# Altium schematic sheet GR_carte_alim27.SchDoc
size A4; SheetNumber: 1; SheetTotal: 1
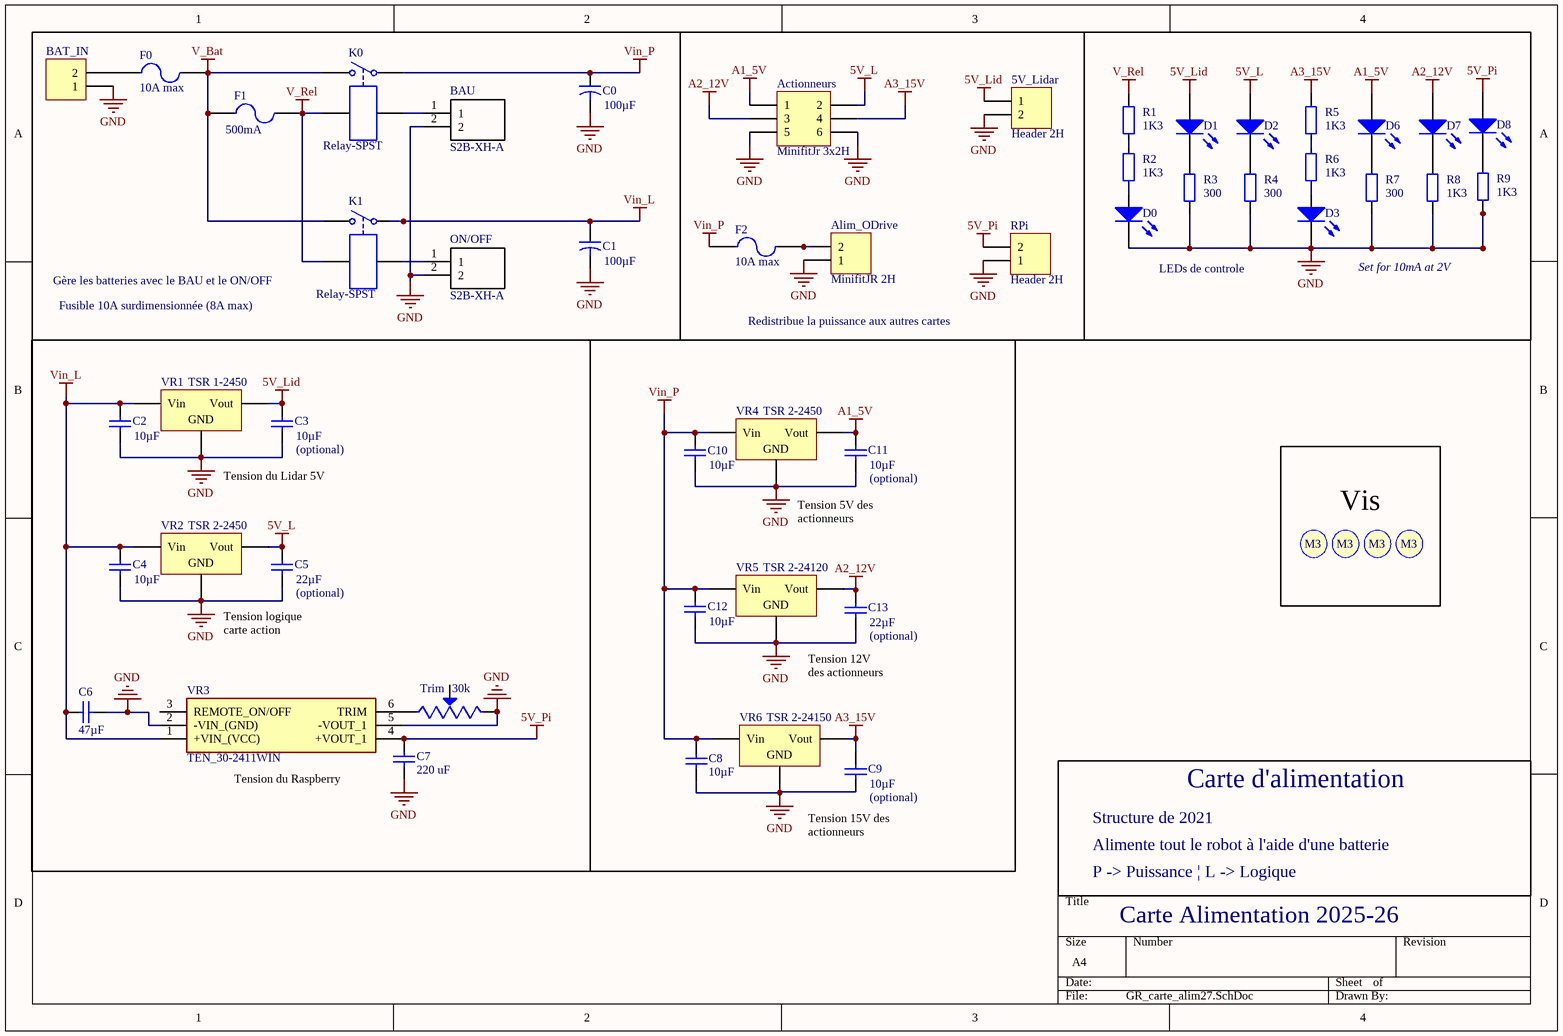
[diagram p0: GR_carte_alim27.SchDoc]

## Parts
5V_Lidar  Header 2H  [S2B-XH-A]
Actionneurs  MinifitJr 3x2H  [MOLEX_MINIFITJR_3X2]
Alim_ODrive  MinifitJR 2H  [Molex_MiniFitJr_2x1H]
BAT_IN  Battery Onboard Solder  [Battery SALE]  (value not drawn)
BAU  S2B-XH-A  [S2B-XH-A]
C0  value 100µF  [Condensateur]  (hidden comment: Cap2)
C1  value 100µF  [Condensateur]  (hidden comment: Cap2)
C2  value 10µF  [Capacitor 1206]  (hidden comment: Cap)
C3  (optional)  value 10µF  [Capacitor 1206]
C4  value 10µF  [Capacitor 1206]  (hidden comment: Cap)
C5  (optional)  value 22µF  [Capacitor 1206]
C6  value 47µF  [Capacitor 1206]  (hidden comment: Cap)
C7  value 220 uF  [Capacitor 1206]  (hidden comment: Cap)
C8  value 10µF  [Capacitor 1206]  (hidden comment: Cap)
C9  (optional)  value 10µF  [Capacitor 1206]
C10  value 10µF  [Capacitor 1206]  (hidden comment: Cap)
C11  (optional)  value 10µF  [Capacitor 1206]
C12  value 10µF  [Capacitor 1206]  (hidden comment: Cap)
C13  (optional)  value 22µF  [Capacitor 1206]
D0  V_Rel  [KP-3216SEC]  (value not drawn)
D1  5V_L  [KP-3216SEC]  (value not drawn)
D2  5V_Lid  [KP-3216SEC]  (value not drawn)
D3  V_Rel  [KP-3216SEC]  (value not drawn)
D6  A_1  [KP-3216SEC]  (value not drawn)
D7  A_2_12V  [KP-3216SEC]  (value not drawn)
D8  A_2_12V  [KP-3216SEC]  (value not drawn)
F0  10A max  [Fuse - duplicate]
F1  500mA  [3.5X2.8X1.9]
F2  10A max  [Fuse - duplicate]
K0  Relay-SPST  [Relay]
K1  Relay-SPST  [Relay]
ON/OFF  S2B-XH-A  [S2B-XH-A]
R1  value 1K3  [Resistor 1206]  (hidden comment: Res2)
R2  value 1K3  [Resistor 1206]  (hidden comment: Res2)
R3  value 300  [Resistor 1206]  (hidden comment: Res2)
R4  value 300  [Resistor 1206]  (hidden comment: Res2)
R5  value 1K3  [Resistor 1206]  (hidden comment: Res2)
R6  value 1K3  [Resistor 1206]  (hidden comment: Res2)
R7  300  [Resistor 1206]
R8  1K3  [Resistor 1206]
R9  1K3  [Resistor 1206]
RPi  Header 2H  [Molex_MiniFitJr_2x1H]
S1  Screw M3  [Screw M3]  (value not drawn)
S2  Screw M3  [Screw M3]  (value not drawn)
S3  Screw M3  [Screw M3]  (value not drawn)
S4  Screw M3  [Screw M3]  (value not drawn)
Trim  30k  [TRIM_3296W-1-303]
VR1  TSR 1-2450  [TRS]
VR2  TSR 2-2450  [TRS]
VR3  TEN_30-2411WIN  [TEN302411WIN]
VR4  TSR 2-2450  [TRS]
VR5  TSR 2-24120  [TRS]
VR6  TSR 2-24150  [TRS]

## Blocks framed on the sheet
Redistribue la puissance aux autres cartes: 5V_Lidar Actionneurs Alim_ODrive F2 RPi

## Nets
5V_L: Actionneurs.2 C5.2 D2.1(A) VR2.3(Vout)
5V_Lid: 5V_Lidar.1 C3.2 D1.1(A) VR1.3(Vout)
5V_Pi: C7.1 D8.1(A) RPi.2 VR3.4(+VOUT_1)
A1_5V: Actionneurs.1 C11.2 D6.1(A) VR4.3(Vout)
A2_12V: Actionneurs.3 C13.2 D7.1(A) VR5.3(Vout)
A3_15V: Actionneurs.4 C9.2 R5.1 VR6.3(Vout)
GND: 5V_Lidar.2 Actionneurs.5 Actionneurs.6 Alim_ODrive.1 BAT_IN.1 BAU.2 C0.2 C1.2 C2.1 C3.1 C4.1 C5.1 C6.1 C7.2 C8.2 C9.1 C10.1 C11.1 C12.1 C13.1 D0.2(K) D3.2(K) ON/OFF.2 R3.1 R4.1 R7.2 R8.2 R9.2 RPi.1 Trim.3(CW) VR1.2(GND) VR2.2(GND) VR3.2(-VIN_(GND)) VR3.5(-VOUT_1) VR4.2(GND) VR5.2(GND) VR6.2(GND)
V_Bat: F0.2 F1.1 K0.2 K1.2
V_Rel: F1.2 K0.4 K1.4 R1.1
Vin_L: C1.1 C2.2 C4.2 C6.2 K1.1 VR1.1(Vin) VR2.1(Vin) VR3.1(+VIN_(VCC))
Vin_P: C0.1 C8.1 C10.2 C12.2 F2.1 K0.1 VR4.1(Vin) VR5.1(Vin) VR6.1(Vin)
NetAlim_ODrive_2: Alim_ODrive.2 F2.2
NetBAT_IN_2: BAT_IN.2 F0.1
NetBAU_1: BAU.1 K0.3
NetD0_1: D0.1(A) R2.2
NetD1_2: D1.2(K) R3.2
NetD2_2: D2.2(K) R4.2
NetD3_1: D3.1(A) R6.2
NetD6_2: D6.2(K) R7.1
NetD7_2: D7.2(K) R8.1
NetD8_2: D8.2(K) R9.1
NetK1_3: K1.3 ON/OFF.1
NetR1_2: R1.2 R2.1
NetR5_2: R5.2 R6.1
NetTrim_1: Trim.1(CCW) VR3.6(TRIM)

Not connected (* = marked no-connect by the designer): Trim 2(WIPER); VR3 3(REMOTE_ON/OFF)

## Notes on the sheet
- (near K1) Gère les batteries avec le BAU et le ON/OFF
- Fusible 10A surdimensionnée (8A max)
- LEDs de controle
- Set for 10mA at 2V
- Tension du Lidar 5V
- Vis
- Tension 5V des actionneurs
- Tension logique carte action
- Tension 12V des actionneurs
- (near VR3) Tension du Raspberry
- Carte d'alimentation
- Tension 15V des actionneurs
- Structure de 2021
- Alimente tout le robot à l'aide d'une batterie
- P -> Puissance | L -> Logique
- Carte Alimentation 2025-26
- (in symbol Screw M3) M3

## Library data of the parts
5V_Lidar RPi = Header 2H: Header, 2-Pin, Right Angle; LatestRevisionDate: 17-Jul-2002; LatestRevisionNote: Re-released for DXP Platform.; Publisher: Altium Limited
Actionneurs = Header 3X2H: Header, 3-Pin, Dual row, Right Angle; LatestRevisionDate: 17-Jul-2002; LatestRevisionNote: Re-released for DXP Platform.; Publisher: Altium Limited
Alim_ODrive = Header 2: Header, 2-Pin; LatestRevisionDate: 17-Jul-2002; LatestRevisionNote: Re-released for DXP Platform.; Publisher: Altium Limited
BAT_IN = Header 2: Header, 2-Pin / Battery Onboard Solder / 24V; LatestRevisionDate: 17-Jul-2002; LatestRevisionNote: Re-released for DXP Platform.; Publisher: Altium Limited
BAU ON/OFF = S2B-XH-A-1_LF__SN_: Connector; Manufacturer_Name: JST (JAPAN SOLDERLESS TERMINALS); Manufacturer_Part_Number: S2B-XH-A-1(LF)(SN); Datasheet Link: http://www.jst-mfg.com/product/pdf/eng/eXH.pdf; Height: 6.1mm; Arrow Part Number: S2B-XH-A-1(LF)(SN)
C0 C1 = Cap2: Capacitor; Published: 23-Sep-2002; PackageReference: CAPR5-4X5; Publisher: Altium Limited; PackageDescription: Capacitor; 2 Leads
C2-C13 = Cap: Capacitor; Published: 8-Jun-2000; LatestRevisionDate: 17-Jul-2002; LatestRevisionNote: Re-released for DXP Platform.; PackageReference: RAD-0.3; Publisher: Altium Limited; PackageDescription: Radial Cap, Thru-Hole; 2 Leads; 0.3 in Pin Spacing
D0-D3 D6-D8 = LED2: Typical RED, GREEN, YELLOW, AMBER GaAs LED; Published: 8-Jun-2000; LatestRevisionDate: 17-Jul-2002; LatestRevisionNote: Re-released for DXP Platform.; PackageVersion: Feb-2002; PackageReference: 3.2X1.6X1.1; Publisher: Altium Limited; PackageDescription: SM LED; 2 Flat Leads
F0 F2 = Fuse 2: Main Fuse; Published: 8-Jun-2000; LatestRevisionDate: 17-Jul-2002; LatestRevisionNote: Re-released for DXP Platform.; PackageReference: PIN-W2/E2.8; Publisher: Altium Limited; PackageDescription: Thru-Hole; 2 Leads
F1 = Fuse 2: Resettable fuse; Published: 8-Jun-2000; LatestRevisionDate: 17-Jul-2002; LatestRevisionNote: Re-released for DXP Platform.; PackageReference: PIN-W2/E2.8; Publisher: Altium Limited; PackageDescription: Thru-Hole; 2 Leads
K0 K1 = Relay-SPST: Single-Pole Single-Throw Relay; Published: 24-Mar-1999; LatestRevisionDate: 17-Jul-2002; LatestRevisionNote: Re-released for DXP Platform.; PackageReference: MODULE4; Publisher: Altium Limited
R1-R9 = Res2: Resistor; Published: 8-Jun-2000; LatestRevisionDate: 17-Jul-2002; LatestRevisionNote: Re-released for DXP Platform.; PackageReference: AXIAL-0.4; Publisher: Altium Limited; PackageDescription: Axial Device, Thru-Hole; 2 Leads; 0.4 in Pin Spacing
Trim = 3296W-1-303: TRIMMER - 3/8in SQ MT CERMET | Bourns 3296W-1-303; SnapEDA_Link: https://www.snapeda.com/parts/3296W-1-303/Bourns/view-part/?ref=snap; Package: NON STANDARD-3 Bourns; Value: *; MF: Bourns; MP: 3296W-1-303; Check_prices: https://www.snapeda.com/parts/3296W-1-303/Bourns/view-part/?ref=eda
VR1 VR2 VR4-VR6 = Volt Reg: Voltage Regulator; Published: 24-Mar-1999; LatestRevisionDate: 29-May-2009; LatestRevisionNote: IPC-7351 Footprint Added.; PackageReference: D2PAK; Publisher: Altium Limited; PackageDescription: 3-Pin Transistor Outline Package 2.54 mm Pitch, 15.1 mm Lead Span
VR3 = TEN_30-2411WIN: Power Supply; Manufacturer_Name: Traco Power; Manufacturer_Part_Number: TEN 30-2411WIN; Datasheet Link: https://tracopower.com/ten30win-datasheet/; Height: 10.7mm; Mouser Part Number: 495-TEN-30-2411WIN; Mouser Price/Stock: https://www.mouser.co.uk/ProductDetail/TRACO-Power/TEN-30-2411WIN?qs=ckJk83FOD0WILf%252BNmub5Yg%3D%3D